# Altium schematic sheet 100_AC-DC.SchDoc: AC-DC Convertion stage
size A4; Date: xxxxxx; DrawnBy: J.A.Oviedo; Revision: R1V1; SheetNumber: 2; SheetTotal: 5
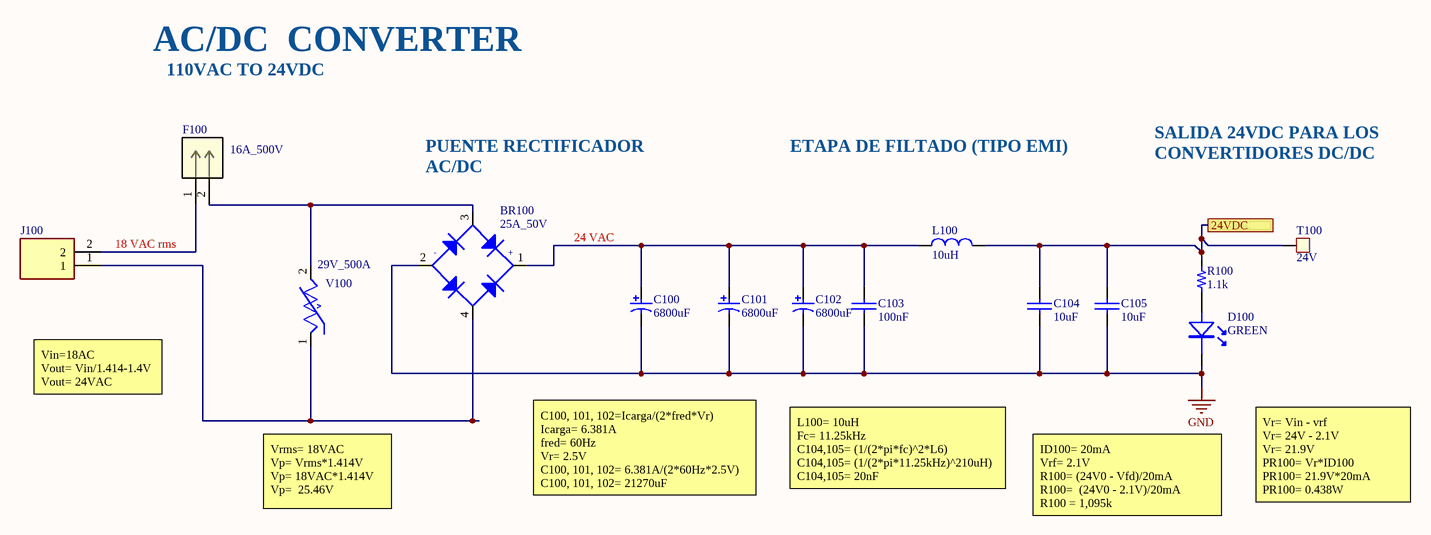
[diagram p0: 100_AC-DC.SchDoc]

## Parts
BR100  25A_50V  [BR_25A_50V_GBJ_Bridge]
C100  value 6800uF  [Cap_6800uF_TH_25*40_50V]  (hidden comment: 6800uF_50V)
C101  value 6800uF  [Cap_6800uF_TH_25*40_50V]  (hidden comment: 6800uF_50V)
C102  value 6800uF  [Cap_6800uF_TH_25*40_50V]  (hidden comment: 6800uF_50V)
C103  value 100nF  [Cap_100nF_X7R-RADIAL_50V]  (hidden comment: 100nF_50V)
C104  value 10uF  [Cap_10uF_X7R_RADIAL_50V]  (hidden comment: 10uF_50V)
C105  value 10uF  [Cap_10uF_X7R_RADIAL_50V]  (hidden comment: 10uF_50V)
D100  GREEN  [LED_TH_5MM_GREEN]
F100  16A_500V  [F_16A_500V_Cartridge_5x20mm_OGN]
J100  Con_2*1_TH_5mm_14.3*10.5_300V_15A  [Con_2*1_TH_5mm_14.3*10.5_300V_15A]  (value not drawn)
L100  value 10uH  [3L_10uH_10A_THT_25*3]  (hidden comment: 10uH_10A)
R100  value 1.1k  [Res_1k1_TH_0.5W]  (hidden comment: 1k1_0.5W)
T100  24V  [TP_SMD_45mil]  (no BOM)
V100  29V_500A  [Var_29V_500A_TH_DISC_10MM]

## Ports
24VDC (see 000_Hierarchical[2C], 200_DC-DC[1A], 300_DC-DC_Part2[1A], 400_DC-DC_Part3[1B])

## Nets
GND: BR100.2 C100.2 C101.2 C102.2 C103.2 C104.2 C105.2 D100.2(K)
24VDC: C104.1 C105.1 L100.2 R100.2 T100.1 ; port 24VDC
NetBR100_1: BR100.1 C100.1 C101.1 C102.1 C103.1 L100.1
NetBR100_3: BR100.3 F100.2 V100.2
NetBR100_4: BR100.4 J100.1 V100.1
NetD100_1: D100.1(A) R100.1
NetF100_1: F100.1 J100.2

## Notes on the sheet
- AC/DC  CONVERTER
- 110VAC TO 24VDC
- SALIDA 24VDC PARA LOS
- PUENTE RECTIFICADOR
- (near BR100) AC/DC
- ETAPA DE FILTADO (TIPO EMI)
- CONVERTIDORES DC/DC
- 18 VAC rms
- 24 VAC
- Vin=18AC                                                                                   Vout= Vin/1.414-1.4V
  Vout= 24VAC
- Vrms= 18VAC
  Vp= Vrms*1.414V
  Vp= 18VAC*1.414V
  Vp=  25.46V
- C100, 101, 102=Icarga/(2*fred*Vr)
  Icarga= 6.381A
  fred= 60Hz
  Vr= 2.5V
  C100, 101, 102= 6.381A/(2*60Hz*2.5V)
  C100, 101, 102= 21270uF
- L100= 10uH
  Fc= 11.25kHz
  C104,105= (1/(2*pi*fc)^2*L6)
  C104,105= (1/(2*pi*11.25kHz)^210uH)
  C104,105= 20nF
- ID100= 20mA
  Vrf= 2.1V
  R100= (24V0 - Vfd)/20mA
  R100=  (24V0 - 2.1V)/20mA
  R100 = 1,095k
- Vr= Vin - vrf
  Vr= 24V - 2.1V
  Vr= 21.9V
  PR100= Vr*ID100
  PR100= 21.9V*20mA
  PR100= 0.438W
- Title:
- Project:
- File:
- Revision:
- Date:
- Size:
- A4
- Drawn by:
- (in symbol BR_25A_50V_GBJ_Bridge) -; +

## Library data of the parts
BR100 = BR_25A_50V_GBJ_Bridge: BRIDGE RECT 1PHASE 50V 25A TS-6P; Manufacturer: onsemi; Manufacturer Part Number: DFB2505; Supplier 1: Digi-Key; Supplier Part Number 1: DFB2505-ND; Reel Stock: N/A; Last modified by: J.A.Oviedo; Last modified date: 20261022; ComponentLink1Description: Digi-Key; ComponentLink1URL: https://www.digikey.com/product-detail/en/smc-diode-solutions/KMB24STR/1655-1884-1-ND/7898353
C100-C102 = Cap_6800uF_TH_25*40_50V: CAP ALUM 6800UF 20% 50V SNAP TH; Manufacturer: Cornell Dubilier Knowles; Manufacturer Part Number: SLPX682M050C7P3; Last modified by: J.A.Oviedo; Last modified date: 2026/10/22; ComponentLink1Description: Digi-Key; ComponentLink1URL: https://www.digikey.com/products/en?keywords=493-10137-1-ND; Supplier 1: Digi-Key; Supplier Part Number 1: SLPX682M050C7P3
C103 = Cap_100nF_X7R-RADIAL_50V: CAP CER 0.1UF 50V X7R RADIAL; Manufacturer: KEMET; Manufacturer Part Number: C320C104K5R5TA; Supplier 1: Digi-Key; Supplier Part Number 1: 399-4264-ND; Last modified by: J.A.Oviedo; Last modified date: 20261022
C104 C105 = Cap_10uF_X7R_RADIAL_50V: 10 µF ±10% 50V Capacitores cerámicos X7R Radial; Manufacturer: TDK; Manufacturer Part Number: FG20X7R1H106KRT06; Supplier 1: Digi-Key; Supplier Part Number 1: 445-173297-1-ND; Last modified by: J.A.Oviedo; Last modified date: 20261022
D100 = LED_TH_5MM_GREEN: LED GREEN DIFFUSED 5MM ROUND T/H; Manufacturer: Würth Elektronik; Manufacturer Part Number: 151051VS04000; Supplier 1: Digi-key; Supplier Part Number 1: 732-5017-ND; Last modified by: J.A.Oviedo; Last modified date: 20261022; Reel Stock: N/A; ComponentLink1Description: Digi-key; ComponentLink1URL: https://www.digikey.tw/products/en?keywords=511-1635-1-ND
F100 = F_16A_500V_Cartridge_5x20mm_OGN: Fusible Bloque 16 A 500V 1 Circuitos Cartucho Orificio pasante; Manufacturer: SCHURTER Inc.; Manufacturer Part Number: 3-132-874; Supplier 1: Digi-key; Supplier Part Number 1: 486-3-132-874-ND; Reel Sotck: N/A; Last modified by: J.A.Oviedo; Last modified date: 20261021
J100 = Con_2*1_TH_5mm_14.3*10.5_300V_15A: 2 Bloques de terminales - Cable a placa Horizontal con placa 0.197" (5.00mm) Orificio pasante; Manufacturer: Same Sky (Formerly CUI Devices); Manufacturer Part Number: TB002-500-02BE; Supplier 1: Digi-key; Supplier Part Number 1: 102-6145-ND; Reel Stock: N/A; Last modified by: J.A.Oviedo; Last modified date: 20261021
L100 = L_10uH_10A_THT_25*3: 10 µH No blindado Núcleo de tambor, cableado Inductivo 10 A 8.8mOhm Cilindro radial y horizontal (abierto); Manufacturer: Würth Elektronik; Manufacturer Part Number: 744711010; Supplier 1: Digy-key; Supplier Part Number 1: 732-3259-ND; Reel Stock: N/A; Last modified by: J.A.Oviedo; Last modified date: 20261022
R100 = Res_1k1_TH_0.5W: RES 1.1kΩ ±1% 500mW Through Hole,D2.4xL6.3mm; Manufacturer: YAGEO; Manufacturer Part Number: MFR50SFTE52-1K1; Supplier 1: LCSC; Supplier Part Number 1: YAGEO MFR50SFTE52-1K1; Reel Stock: N/A; Last modified by: J.A.Oviedo; Last modified date: 20261023
T100 = TP_SMD_45mil: Test point 45mil pad size; Last modified by: J.Jaramillo; Last modified date: 20240310
V100 = Var_29V_500A_TH_DISC_10MM: 39 V 500 A Varistor 1 Circuitos Orificio pasante Tipo moneda 10mm; Manufacturer: TDK; Manufacturer Part Number: B72210S0250K101; Supplier 1: Digi-key; Supplier Part Number 1: 495-3768-ND; Reel Sotck: N/A; Last modified by: J.Jaramillo; Last modified date: 20240309